# EAGLE design breakbeamTx-v1.0 (EAGLE 9.6.2)
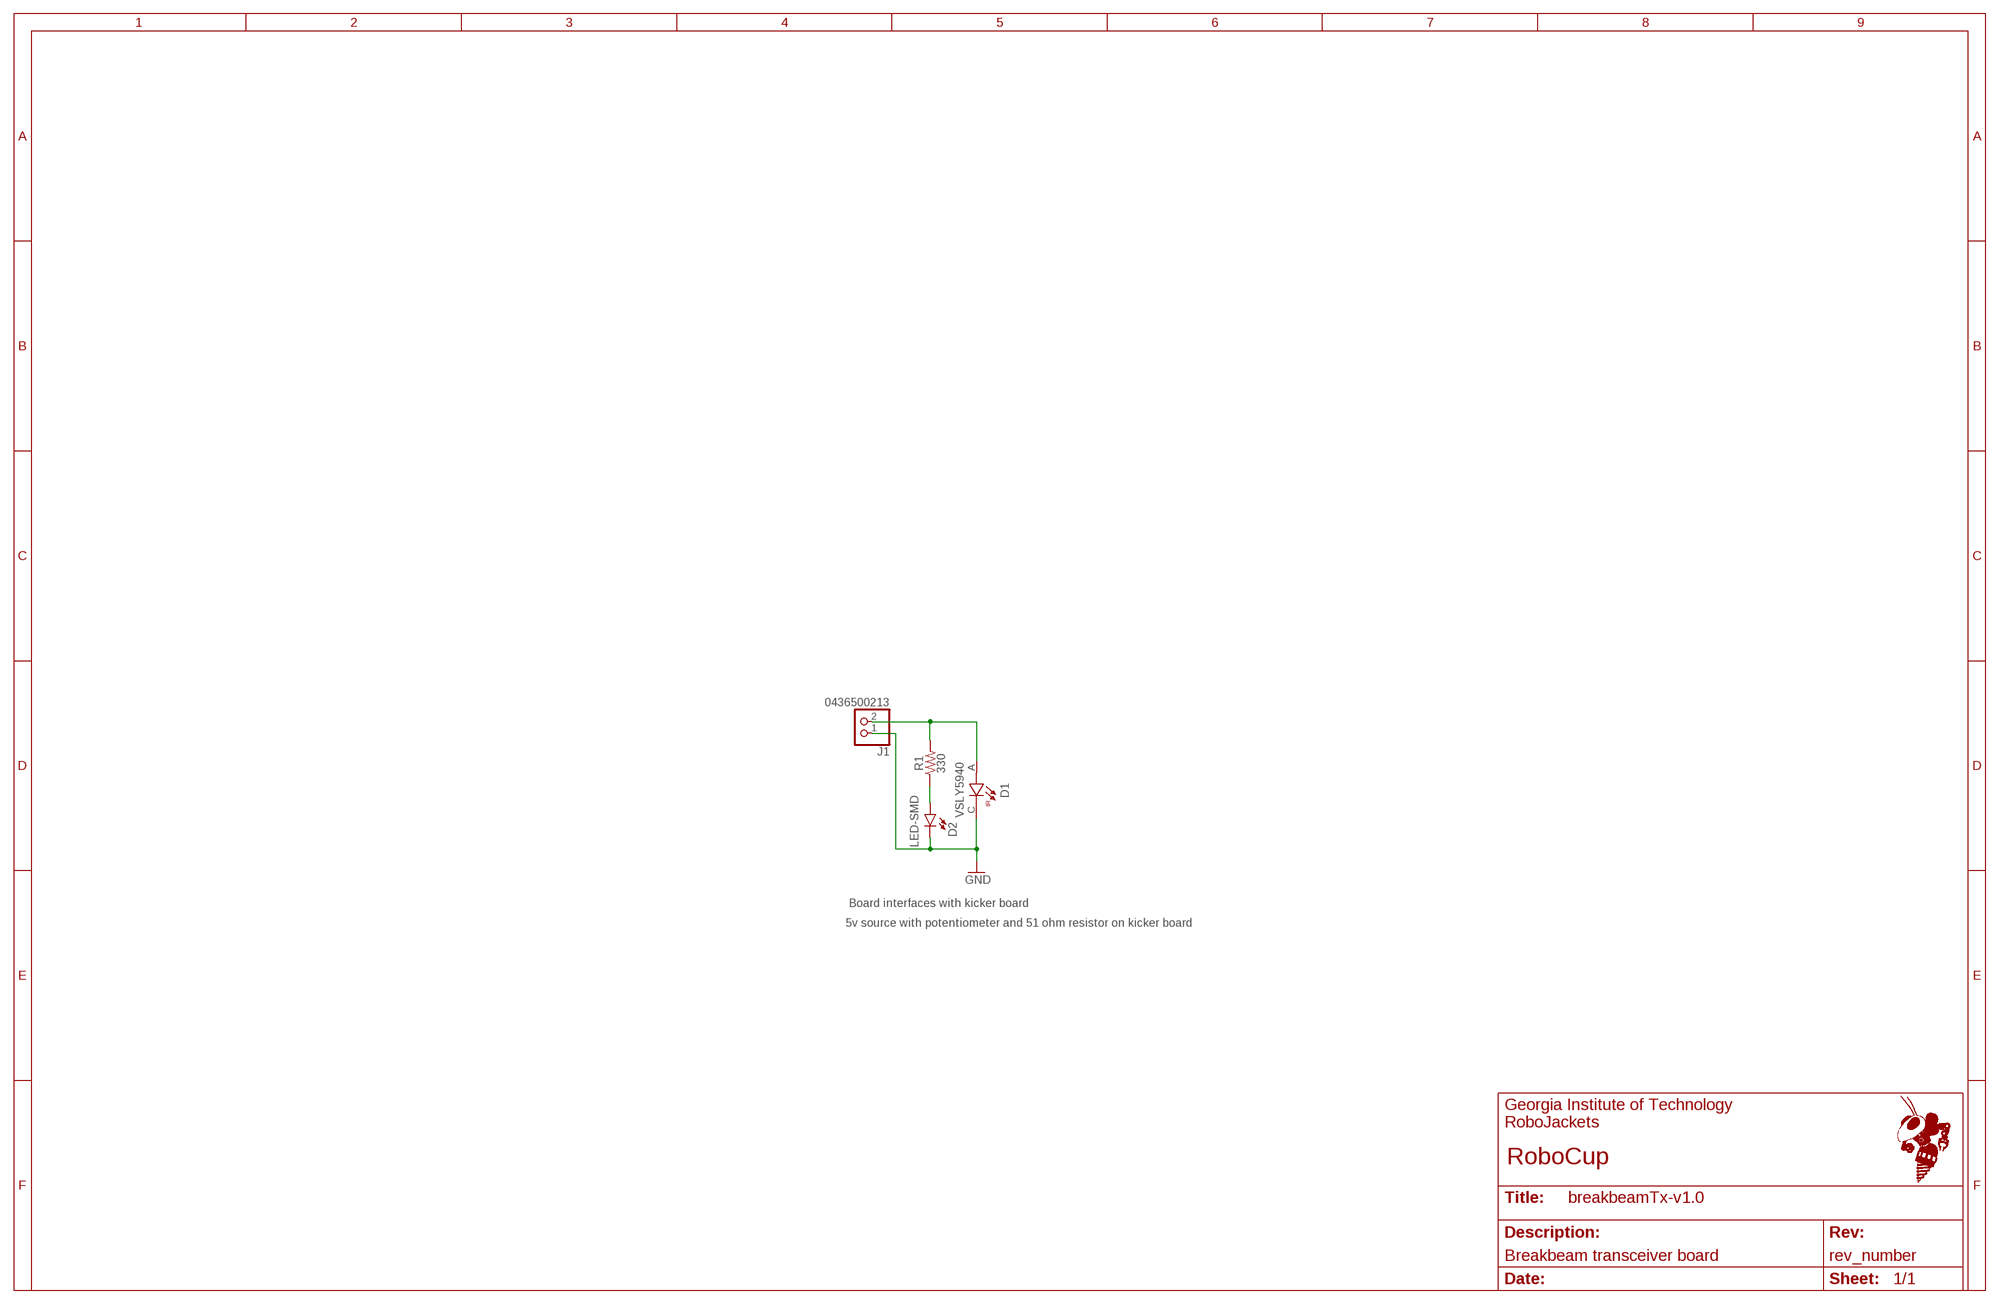
[diagram p0: schematic, sheet 1]
FRAME1 (FRAME_11_17): REVISION: rev_number; SCH_DESC: Breakbeam transceiver board; TEAM: RoboCup

## Parts
D1  VSLY5940  [LEDRD254W50D590H1318]
D2  LED-SMD  [LED0603]
J1  0436500213  [0436500213]
R1  330  R330-0603-1/10W-5%  [0603]

## Nets
BB_TX: D1.A J1.2 R1.2
GND: D1.C D2.C J1.1
N$2: D2.A R1.1

## Notes on the sheet
- Board interfaces with kicker board
- 5v source with potentiometer and 51 ohm resistor on kicker board

## Library data of the parts
D1 = VSLY5940:VSLY5940: VSLY5940 Series Ø 5 mm ±3° 940 nm 600 mw/sr Infrared Emitting Diode - T-1 3/4; DESCRIPTION: Infrared (IR) Emitter 940nm 1.65V 100mA 300mW/sr @ 100mA 6° Radial; DIGI-KEY_PART_NUMBER: VSLY5940-ND; MF: Vishay Semiconductor; MP: VSLY5940; PACKAGE: Radial Vishay Semiconductor; PURCHASE-URL: https://pricing.snapeda.com/search/part/VSLY5940/?ref=eda
D2 = RoboJackets-LEDs:LED-SMD: Series of 0603 LEDs
J1 = RoboJackets-Connectors:0436500213
R1 = RoboJackets-Resistors:R330: 330Ω resistor A resistor is a passive two-terminal electrical component that implements electrical resistance as a circuit element. Resistors act to reduce current flow, and, at the same time, act to lower voltage levels within circuits. - Wikipedia Datasheet Link: https://industrial.panasonic.com/ww/products/pt/general-purpose-chip-resistors/models/ERJ3GEYJ6R2V

## Board
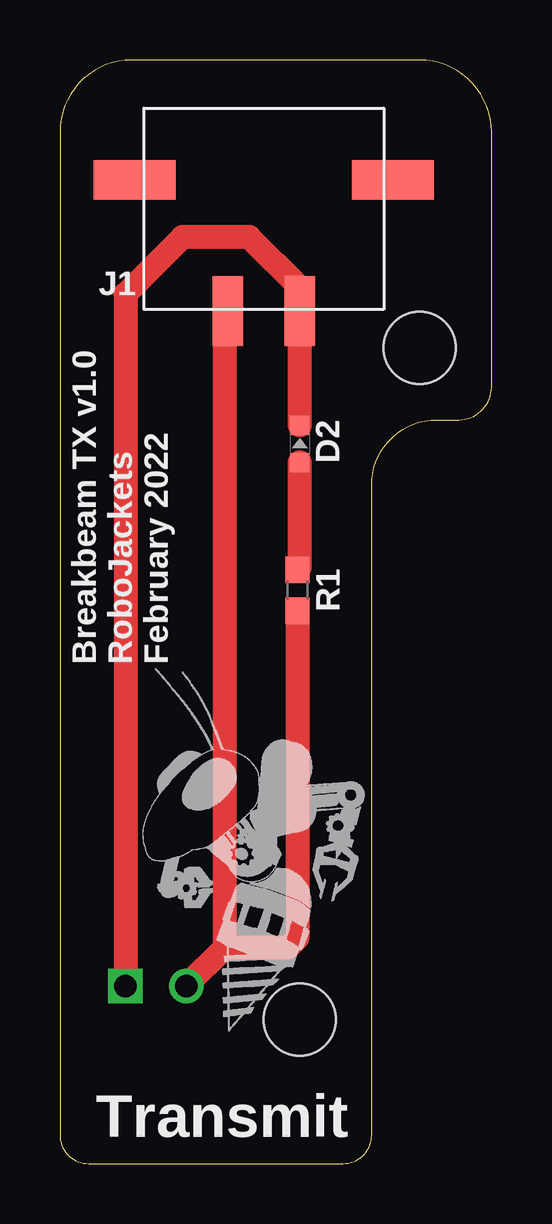
[diagram p1: board, top side]
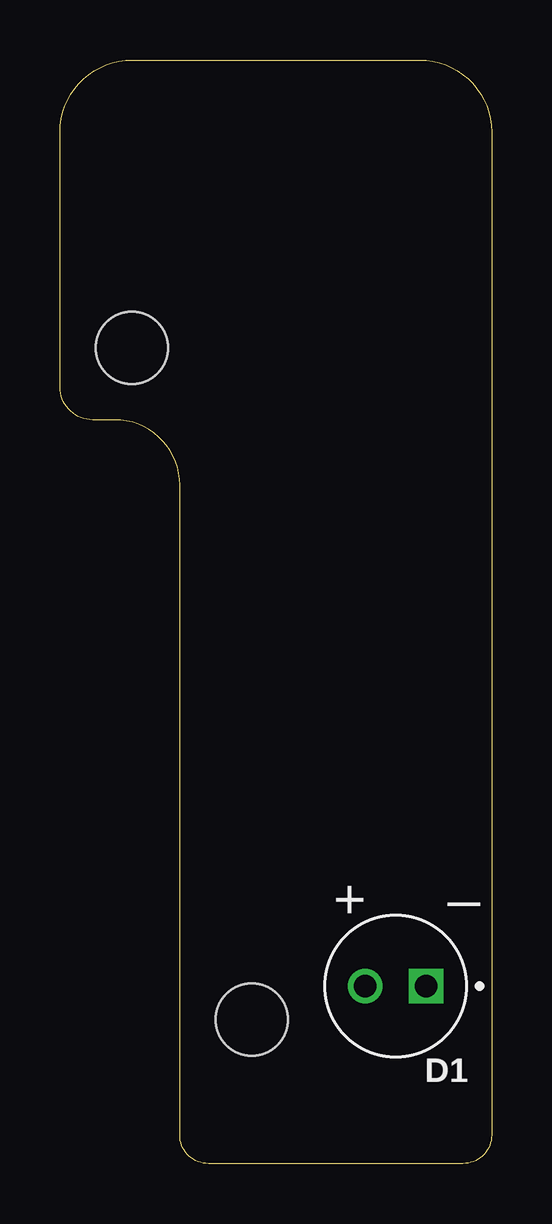
[diagram p2: board, bottom side, seen from below]

Size 18 x 46 mm. Coordinates in mm from the lower left corner, seen from the top.
Outline: 13,1.19 13,28.28 arc-90 15.72,31 16.63,31 arc90 18,32.37 18,42.99 arc90 14.99,46 3,46 arc90 0,43 0,1.19 arc90 1.19,0 11.81,0 arc90 13,1.19
Copper layers (1+16): Top 0.035mm / dielectric 1.53mm / Bottom 0.035mm
Design rules "JLCPCB (2 Layer)": minimum track width 5mil, minimum drill 0.3mm, track to track 5mil, track to pad 5mil, pad to pad 5mil, via to via 20mil, smd to smd 5mil, copper to edge 0.2mm, drill to drill 21mil, minimum pad ring 6mil, minimum via ring 6mil, stop-mask expansion 2mil, vias tented up to drill 30mil, thermal gap 10mil
Holes 3 mm at 15,34 10,6

### Footprints (pad centres in the part's own frame; a part is rotated, then mirrored left to right if it is on the bottom)
LEDRD254W50D590H1318 = drill 0.95 pad 1.43: A 1.27,0 | drill 0.95 pad 1.43 square: C -1.27,0
LED0603 = smd 0.8 x 0.8: A -0.775,0; C 0.775,0
0436500213 = smd 1.27 x 2.92: 1 -1.5,5.47; 2 1.5,5.47 | smd 3.43 x 1.65: P$1 -5.385,0; P$2 5.385,0
0603 = smd 1.1 x 1: 1 -0.85,0; 2 0.85,0

### Placement (x,y rotation side)
D1  4,7.4 180 bottom
D2  10,30 90 top
J1  8.5,41 180 top
R1  9.9,23.9 270 top
U$1  [ROBOBUZZ_0.8X]  7,5.5 0 top

### Tracks (layer width: path | path; a pad name or v marks a point on that pad's centre or on a via)
BB_TX
  Top 1: J1.2 6.87,35.39 6.87,9 | R1.2 9.9,9.4 9.5,9 6.87,9 | 6.87,9 D1.A
GND
  Top 1: D2.C J1.1 10,36.51 7.89,38.62 5.11,38.62 2.73,36.24 D1.C
N$2
  Top 1: R1.1 10,24.85 D2.A

### Text on the board
tPlace: Transmit
bPlace: + | _
tNames: J1 | Breakbeam TX v1.0 / RoboJackets / February 2022